# Altium schematic sheet starfish_3.SchDoc: starfish
size 282 x 208 mm; Origin: Eagle; Date: 4/18/2022 11:53:22 PM; SheetNumber: 4; GateName_1: G$1; SymbolName_1: A4L-LOC; LibraryName: frames; DeviceSetName: A4L-LOC; Sheet: Sheet:
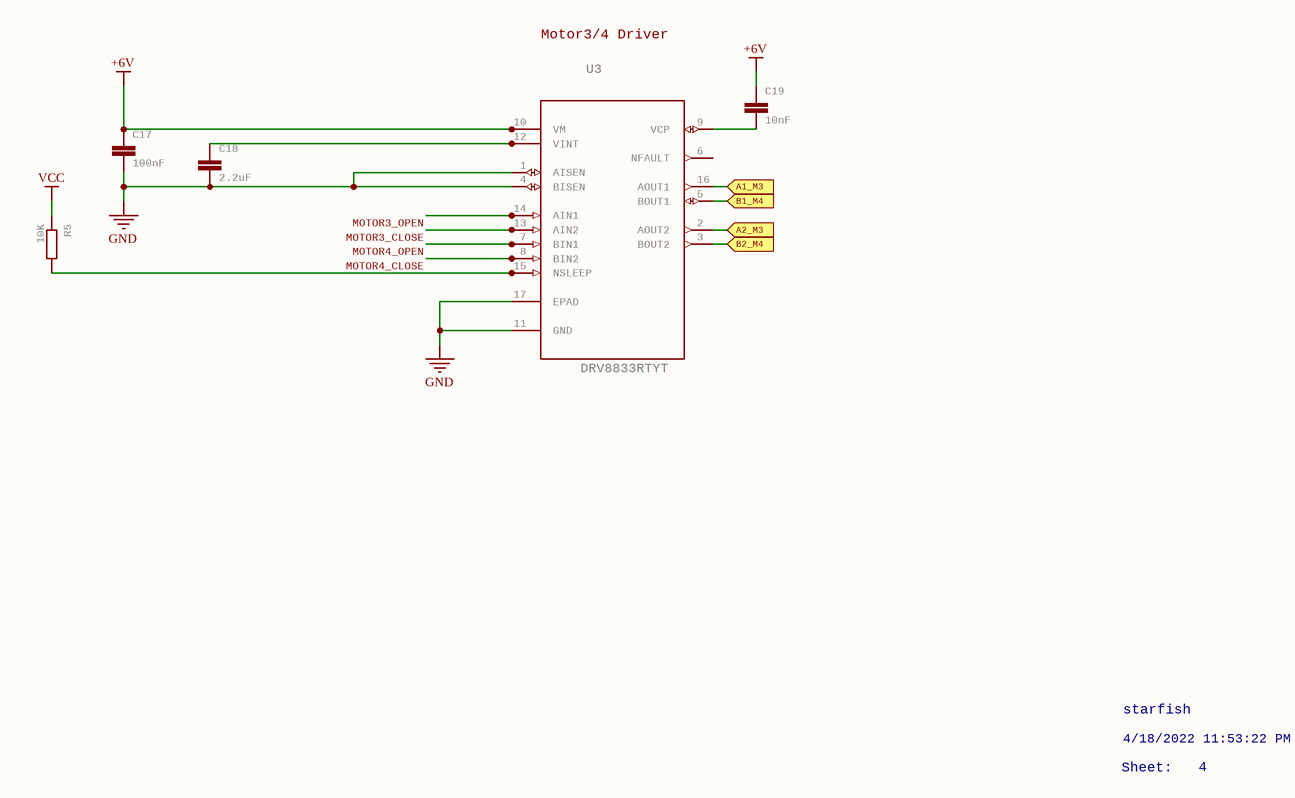
[diagram p0: starfish_3.SchDoc]

## Parts
C17  100nF  [C0603]
C18  2.2uF  [C0603]
C19  10nF  [C0603]
R5  10K  [R0603]
U3  DRV8833RTYT  [QFN65P400X400X80-17N]

## Ports
A1_M3 (in), A2_M3 (in), B1_M4 (in), B2_M4 (in)

## Nets
+6V: C17.1 C19.1 U3.10(VM)
GND: C17.2 C18.2 U3.1(AISEN) U3.4(BISEN) U3.11(GND) U3.17(EPAD)
VCC: R5.1
A1_M3: U3.16(AOUT1) ; port A1_M3
A2_M3: U3.2(AOUT2) ; port A2_M3
B1_M4: U3.5(BOUT1) ; port B1_M4
B2_M4: U3.3(BOUT2) ; port B2_M4
MOTOR3_CLOSE: U3.13(AIN2)
MOTOR3_OPEN: U3.14(AIN1)
MOTOR4_CLOSE: U3.8(BIN2)
MOTOR4_OPEN: U3.7(BIN1)
NetC18_1: C18.1 U3.12(VINT)
NetC19_2: C19.2 U3.9(VCP)
NetR5_2: R5.2 U3.15(NSLEEP)

Not connected (* = marked no-connect by the designer): U3 6(NFAULT)

## Notes on the sheet
- Motor3/4 Driver
- starfish
- Sheet:
- 4/18/2022 11:53:22 PM
- 4

## Library data of the parts
C17-C19 = C-EUC0603: CAPACITOR, European symbol; GateName_1: G$1; SymbolName_1: C-EU; DeviceName: C0603; LibraryName: resistor; DeviceSetName: C-EU
R5 = R-EU_R0603: RESISTOR, European symbol; GateName_1: G$1; SymbolName_1: R-EU; DeviceSetName: R-EU_; DeviceName: R0603; LibraryName: resistor
U3 = DRV8833RTYT: DUAL H-BRIDGE MOTOR DRIVER,QFN-16; GateName_1: A; SymbolName_1: DRV8833RTYT; LibraryName: DRV8833RTYT; DeviceSetName: DRV8833RTYT; MPN: DRV8833RTYT; OC_FARNELL: 2057087; OC_NEWARK: 64T2942; PACKAGE: QFN-16; SUPPLIER: TEXAS INSTRUMENTS